# EasyEDA Pro project GD32F03C8T6最小系统板.eprj

# Schematic Schematic1
Create Date: 2024-03-12; Page Name: P1; Project Name: GD32F03C8T6最小系统板; Schematic Name: Schematic1; Update Date: 2024-07-16; Company: 嘉立创EDA; Page Size: A4; Version: V1.0
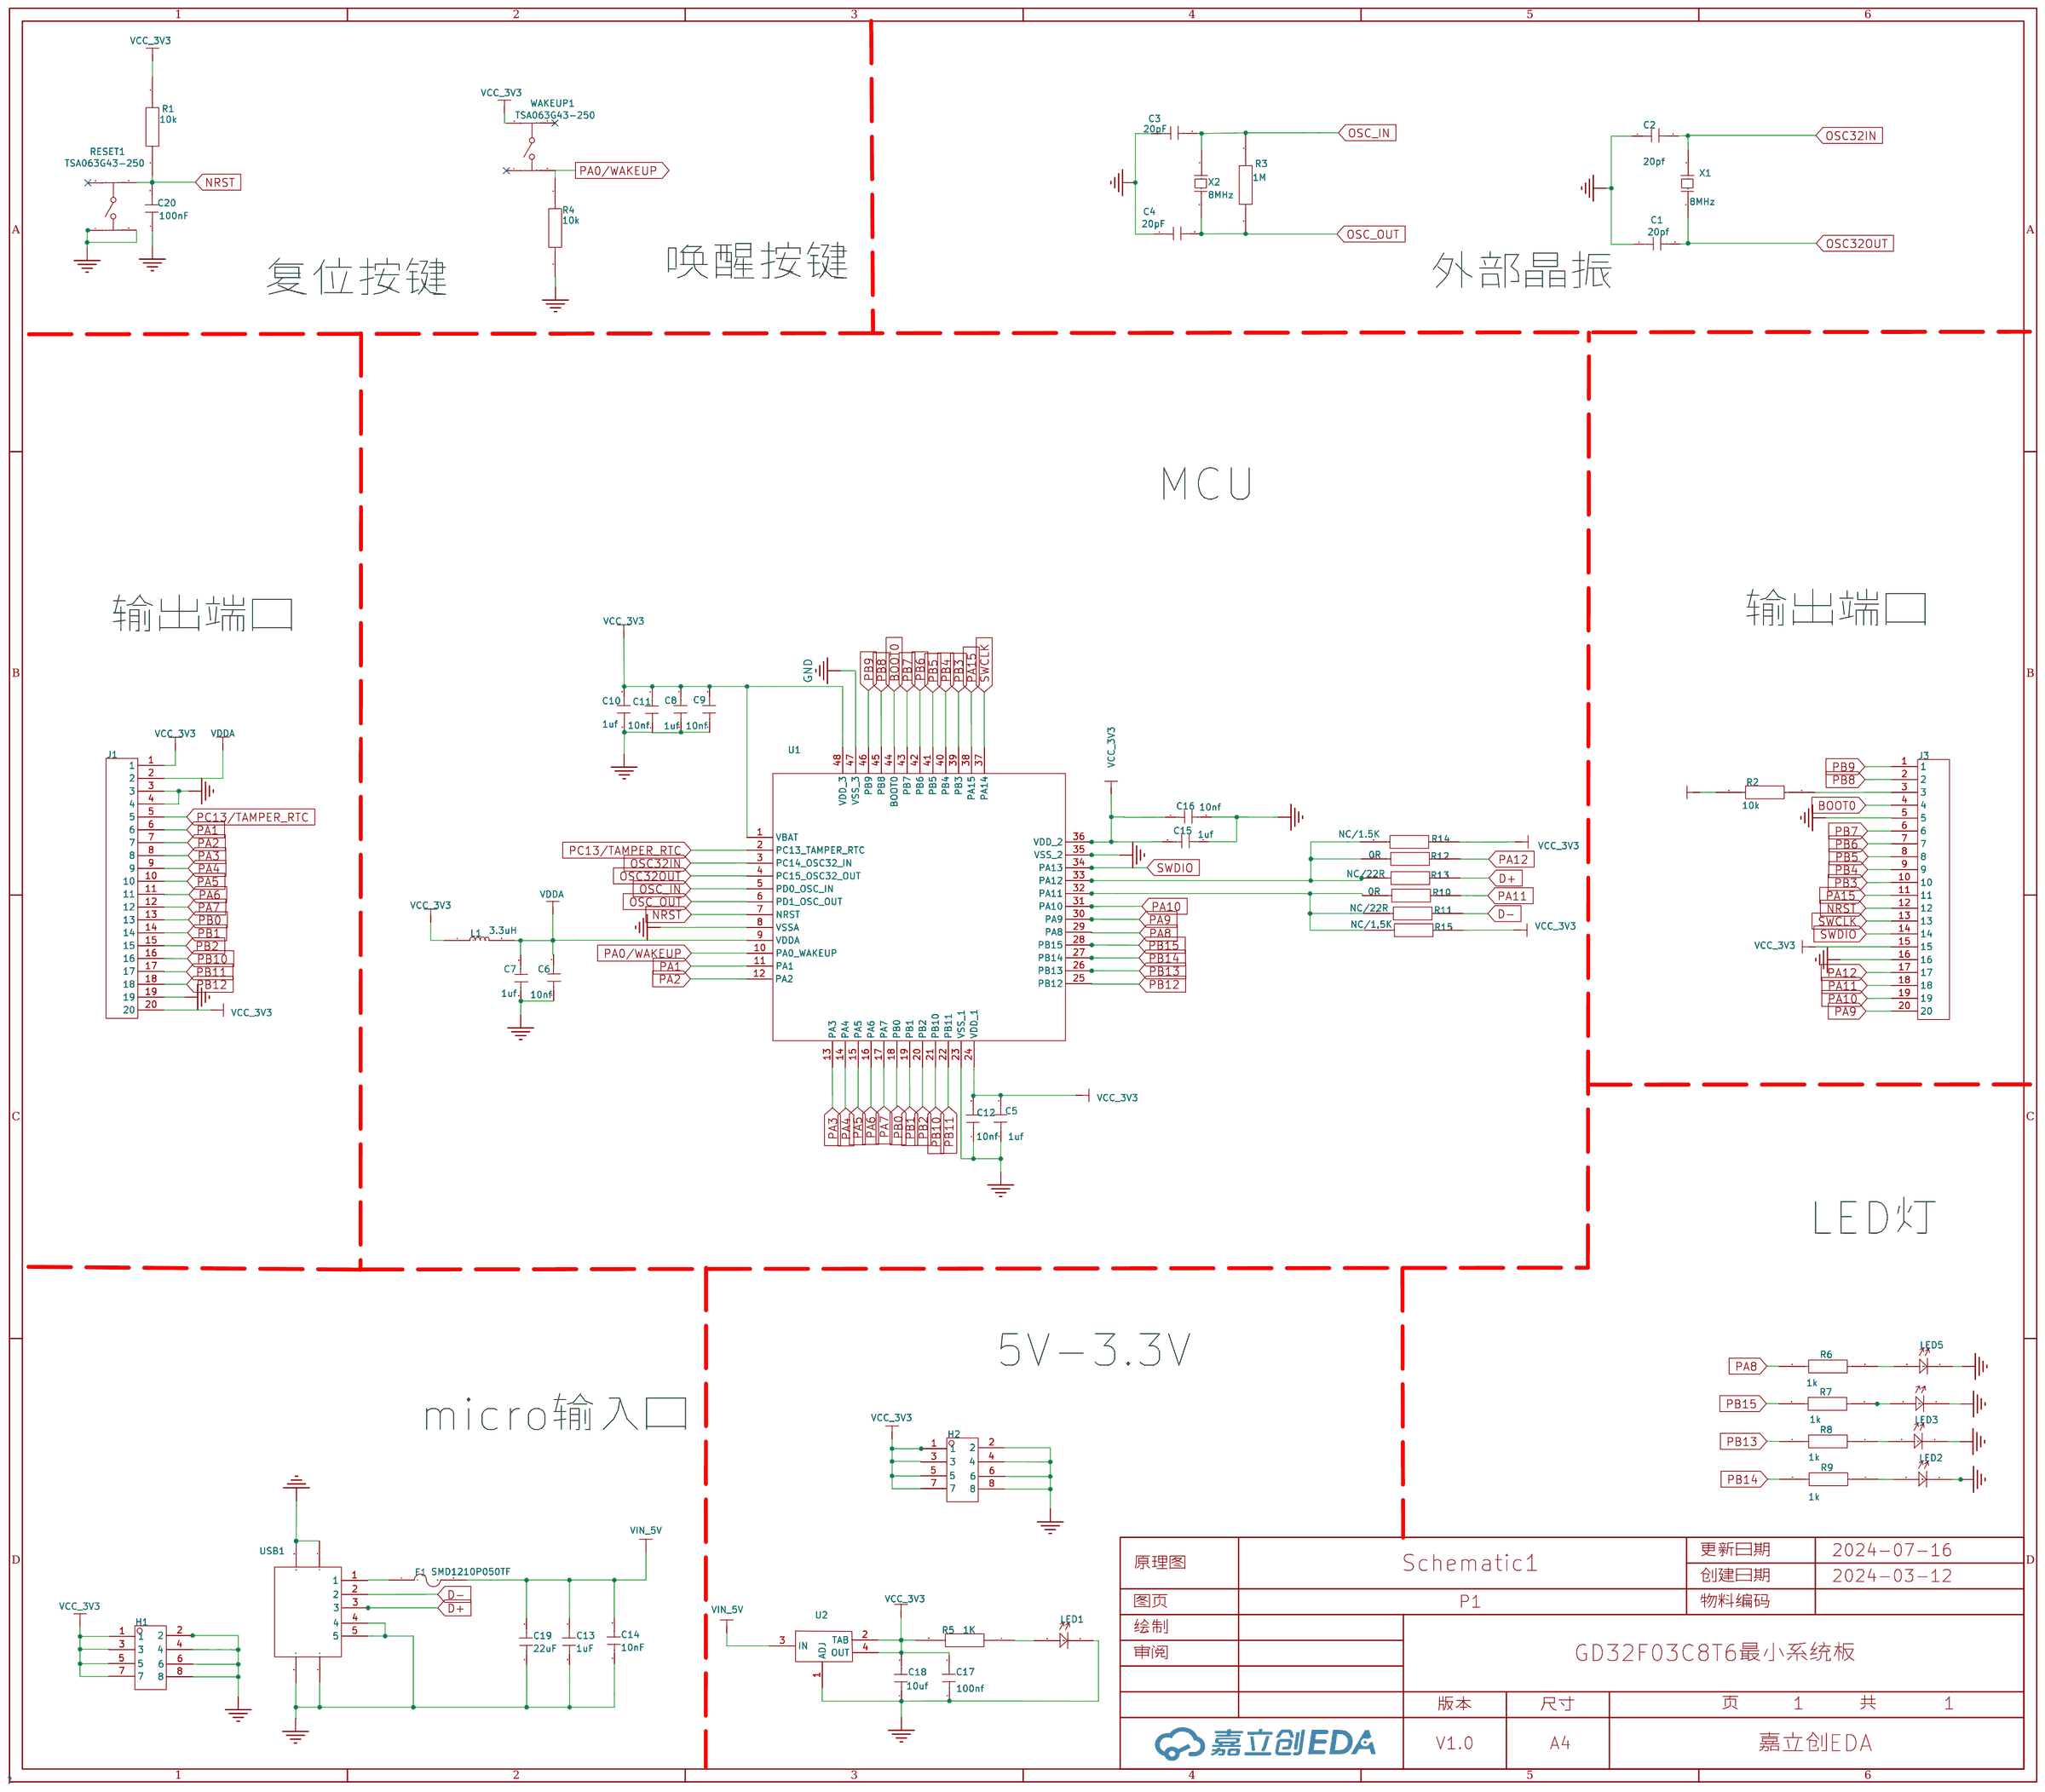
[diagram p0: schematic sheet]

## Parts
C1  20pf  [C0603]
C2  20pf  [C0603]
C3  20pF  [C0603]
C4  20pF  [C0603]
C5  1uf  [C0603]
C6  10nf  [C0603]
C7  1uf  [C0603]
C8  1uf  [C0603]
C9  10nf  [C0603]
C10  1uf  [C0603]
C11  10nf  [C0603]
C12  10nf  [C0603]
C13  1uF  [C0603]
C14  10nF  [C0603]
C15  1uf  [C0603]
C16  10nf  [C0603]
C17  100nf  [C0603]
C18  10uf  [C0805]
C19  22uF  [C0805]
C20  100nF  [C0603]
F1  SMD1210P050TF  [F1210]
H1  -  [HDR-TH_8P-P2.54-V-M-R2-C4-S2.54]
H2  -  [HDR-TH_8P-P2.54-V-M-R2-C4-S2.54]
J1  -  [HDR-TH_20PIN-V-MALE-PITCH2.54]
J3  -  [HDR-TH_20PIN-V-MALE-PITCH2.54]
L1  3.3uH  [L0603]
LED1  -  [LED0603]
LED2  -  [LED0603]
LED3  -  [LED0603]
LED4  -  [LED0603]
LED5  -  [LED0603]
R1  10k  [R0603]
R2  10k  [R0603]
R3  1M  [R0603]
R4  10k  [R0603]
R5  1K  [R0603]
R6  1k  [R0603]
R7  1k  [R0603]
R8  1k  [R0603]
R9  1k  [R0603]
R10  0R  [R0603]
R11  NC/22R  [R0603]
R12  0R  [R0603]
R13  NC/22R  [R0603]
R14  NC/1.5K  [R0603]
R15  NC/1.5K  [R0603]
RESET1  TSA063G43-250  [SW-SWD-T6X6-9.5X5.8]
U1  -  [TQFP-48_L7.0-W7.0-P0.50-LS9.0-BL]
U2  -  [SOT-223]
USB1  -  [MICRO-USB-SMD_U-F-M5DD-Y-1]
WAKEUP1  TSA063G43-250  [SW-SWD-T6X6-9.5X5.8]
X1  8MHz  [DT-38_BD3.1-P0.80]
X2  8MHz  [OSC-49S-1]

## Library data of the parts
C1-C20 = C
F1 = F
H1 H2 = PZ254V-12-8
J1 J3 = HDR-20P
L1 = 3.3uH
LED1-LED5 = LED
R1-R15 = 电阻
RESET1 WAKEUP1 = TSA063G43-205
U1 = GD32F103C8T6
U2 = AMS1117-3.3
USB1 = U-F-M5DD-Y-1
X1 X2 = 晶振

## Nets
GND: C3.1 C5.1 C7.2 C8.1 C9.1 C10.1 C14.1 C15.2 C17.1 C20.1 H1.4 H1.6 H1.8 H2.4 H2.6 H2.8 J3.16 LED1.1 LED2.1 LED3.1 LED4.1 LED5.1 R4.2 RESET1.3 U1.8(VSSA) U1.47(VSS_3) U2.1(ADJ) USB1.4 USB1.5 USB1.6 USB1.7 USB1.8 USB1.9
VCC_3V3: C8.2 C9.2 C10.2 C11.2 C12.2 C15.1 C17.2 C18.2 H1.3 H1.5 H1.7 H2.5 J3.15 R1.1 R2.2 R5.2 R14.1 R15.1 U1.1(VBAT) U1.36(VDD_2) U1.48(VDD_3) U2.2(TAB)
VDDA: C6.1 U1.9(VDDA)
VIN_5V: C13.2 C14.2 C19.2 F1.2 U2.3(IN)
BOOT0: J3.4 U1.44(BOOT0)
D+: R13.1 USB1.3
D-: R11.1 USB1.2
NRST: C20.2 J3.12 RESET1.1 U1.7(NRST)
OSC32IN: U1.3(PC14_OSC32_IN)
OSC32OUT: C1.2
OSC_IN: C3.2 U1.5(PD0_OSC_IN)
OSC_OUT: R3.2 U1.4(PC15_OSC32_OUT) U1.6(PD1_OSC_OUT) X2.1
PA0/WAKEUP: R4.1 U1.10(PA0_WAKEUP) WAKEUP1.3
PA1: U1.11(PA1)
PA2: U1.12(PA2)
PA6: J1.11
PA8: R6.2
PA9: J3.20
PA10: U1.31(PA10)
PA11: R10.1
PA12: R12.1
PA15: U1.38(PA15)
PB0: J1.13
PB3: U1.39(PB3)
PB4: U1.40(PB4)
PB5: J3.8 U1.41(PB5)
PB6: U1.42(PB6)
PB7: U1.43(PB7)
PB8: J3.2 U1.45(PB8)
PB9: J3.1 U1.46(PB9)
PB11: J1.17
PB13: R8.2
PB14: R9.2
PB15: R7.2
PC13/TAMPER_RTC: U1.2(PC13_TAMPER_RTC)
SWCLK: J3.13 U1.37(PA14)
SWDIO: U1.34(PA13)
$1N492: LED2.2 R9.1
$1N2898: LED1.2 R5.1
$1N9058: F1.1 USB1.1
$1N62745: LED3.2 R8.1
$1N62778: LED4.2 R7.1
$1N62791: LED5.2 R6.1
Net-(R12-2): R12.2 U1.33(PA12)
Net-(R15-2): R15.2 U1.32(PA11)

Not connected (* = marked no-connect by the designer): C1 1; C2 1 2; C4 1 2; C5 2; C6 2; C7 1; C11 1; C12 1; C13 1; C16 1 2; C18 1; C19 1; H1 1 2; H2 1 2 3 7; J1 1 2 3 4 5 6 7 8 9 10 12 14 15 16 18 19 20; J3 3 5 6 7 9 10 11 14 17 18 19; L1 1 2; R1 2; R2 1; R3 1; R10 2; R11 2; R13 2; R14 2; RESET1 2* 4; U1 13(PA3) 14(PA4) 15(PA5) 16(PA6) 17(PA7) 18(PB0) 19(PB1) 20(PB2) 21(PB10) 22(PB11) 23(VSS_1) 24(VDD_1) 25(PB12) 26(PB13) 27(PB14) 28(PB15) 29(PA8) 30(PA9) 35(VSS_2); U2 4(OUT); WAKEUP1 1* 2 4*; X1 1 2; X2 2

## Notes on the sheet
- 唤醒按键
- 复位按键
- 外部晶振
- MCU
- 输出端口
- 输出端口
- LED灯
- 5V-3.3V
- micro输入口

# Board PCB1
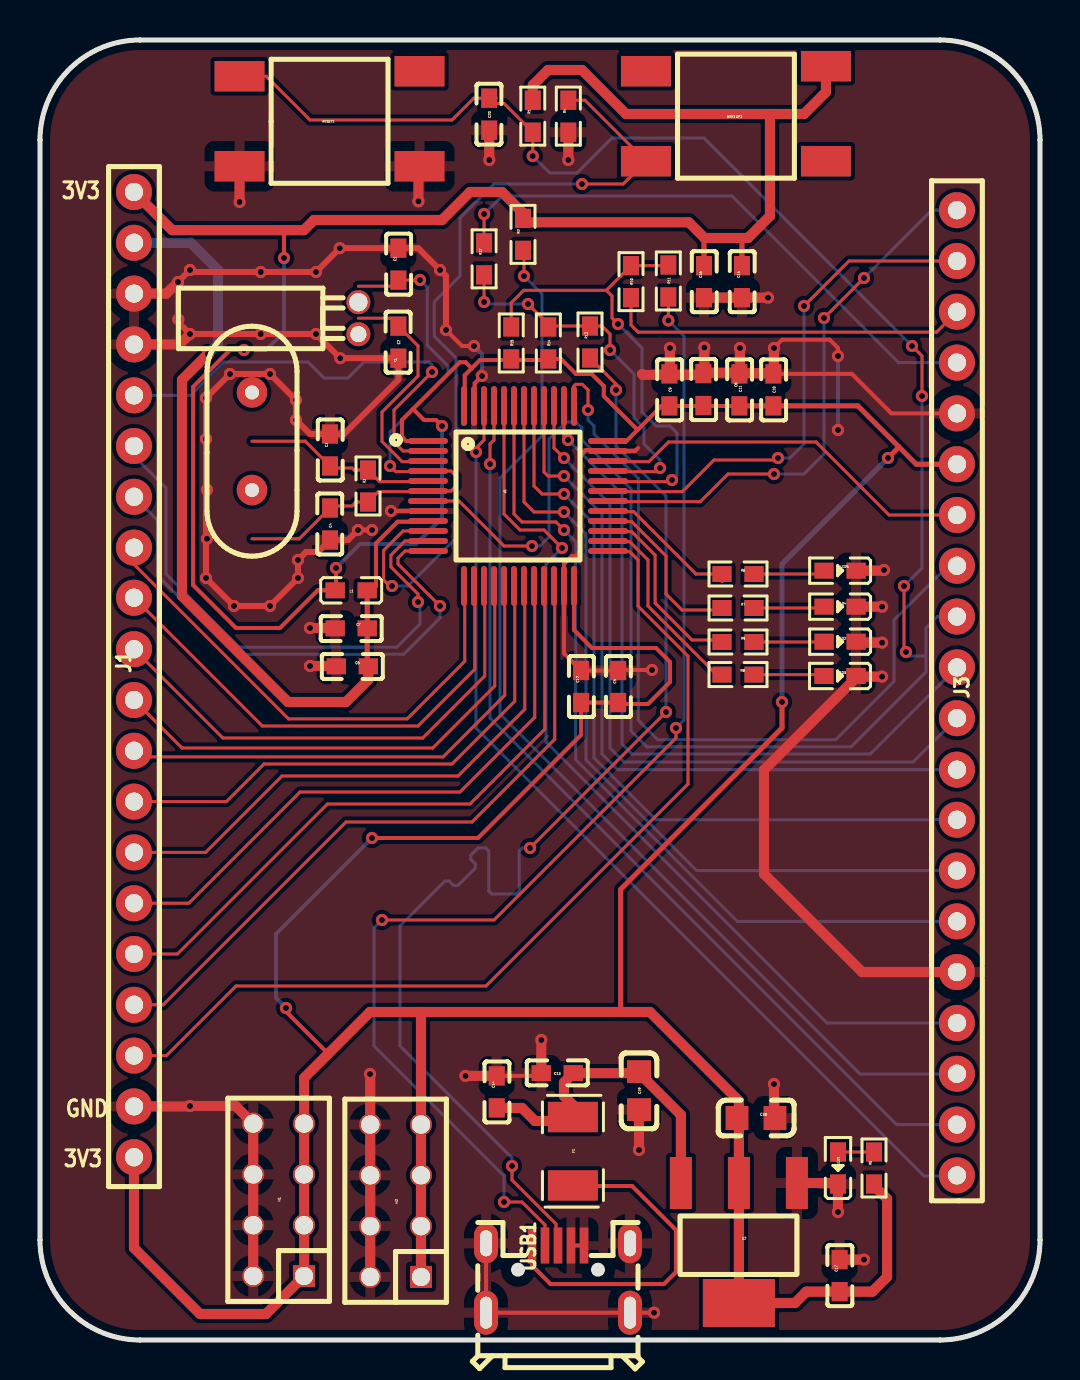
[diagram p1: board, top side]
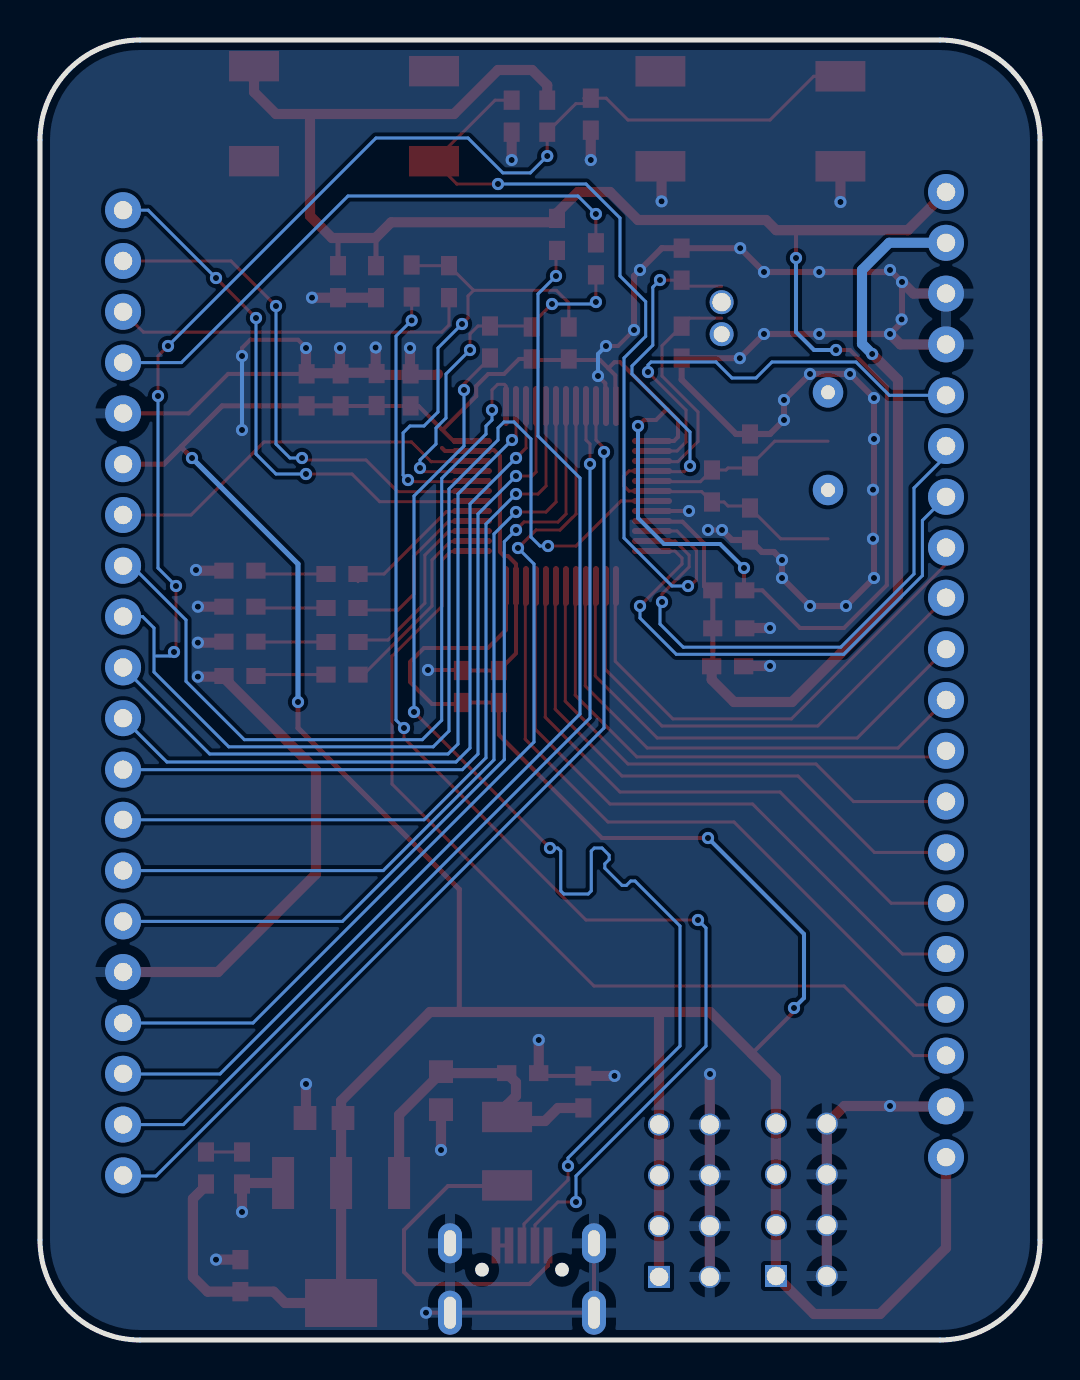
[diagram p2: board, bottom side, seen from below]

Outline 50 x 65 mm; copper layers: Top Layer, Bottom Layer. Coordinates in mm from the lower left corner of the outline.
Outline path: 0,60 0,5 arc(1.46,1.46) 5,0 45,0 arc(48.54,1.46) 50,5 50,60 arc(48.54,63.54) 45,65 5,65 arc(1.46,63.54) 0,60
Stack: Top Layer 0.035mm / Dielectric1 1.51mm FR4 er 4.5 / Bottom Layer 0.035mm

## Design rules (mm)
net GND: power
net VCC_3V3: power
net VIN_5V: power
net VDDA: power
net D+: DP1
net D-: DP1
net $1N9058: power
template: 自定义配置
spacing copperThickness1oz (default): track to track 0.203, other pairs 0.051 to 0.203
spacing copperThickness2oz: track to track 0.203, other pairs 0.152 to 0.3
track width copperThickness1oz (default): min 0.152, default 0.152, max 0.152
track width copperThickness2oz: min 0.152, default 0.152, max 0.152
track width power: min 0.203, default 0.508, max 2.54
differential pair differentialPair (default): width min 0.152, default 0.152, max 0.152; gap min 0.152, default 0.152
via viaSize (default): diameter min 0.5, default 0.61, max 10; hole min 0.3, default 0.305, max 6.299
net class power uses power
net GND uses power
net VCC_3V3 uses power
net VIN_5V uses power
net VDDA uses power
net $1N9058 uses power

## Placement (name value [footprint] x y rotation side)
C1  20pf  [C0603]  17.92 53.79 270 top
C2  20pf  [C0603]  17.92 49.89 90 top
C3  20pF  [C0603]  14.5 44.5 270 top
C4  20pF  [C0603]  14.5 40.8 90 top
C5  1uf  [C0603]  28.91 32.67 270 top
C6  10nf  [C0603]  15.62 33.69 180 top
C7  1uf  [C0603]  15.56 35.58 180 top
C8  1uf  [C0603]  34.97 47.51 270 top
C9  10nf  [C0603]  36.67 47.51 270 top
C10  1uf  [C0603]  31.47 47.51 270 top
C11  10nf  [C0603]  33.17 47.52 270 top
C12  10nf  [C0603]  27.06 32.67 270 top
C13  1uF  [C0603]  25.86 13.34 0 top
C14  10nF  [C0603]  22.84 12.4 270 top
C15  1uf  [C0603]  35.1 52.92 270 top
C16  10nf  [C0603]  33.2 52.92 270 top
C17  100nf  [C0603]  39.98 3.22 270 top
C18  10uf  [C0805]  35.8 11.1 180 top
C19  22uF  [C0805]  29.95 12.47 90 top
C20  100nF  [C0603]  22.46 61.29 90 top
F1  SMD1210P050TF  [F1210]  26.65 9.44 90 top
H1  -  [HDR-TH_8P-P2.54-V-M-R2-C4-S2.54]  13.2 3.2 90 top
H2  -  [HDR-TH_8P-P2.54-V-M-R2-C4-S2.54]  19.05 3.15 90 top
J1  -  [HDR-TH_20PIN-V-MALE-PITCH2.54]  4.7 57.4 270 top
J3  -  [HDR-TH_20PIN-V-MALE-PITCH2.54]  45.85 8.23 90 top
L1  3.3uH  [L0603]  15.56 37.48 0 top
LED1  -  [LED0603]  39.9 8.6 90 top
LED2  -  [LED0603]  40 34.92 180 top
LED3  -  [LED0603]  40 33.2 180 top
LED4  -  [LED0603]  40 36.67 180 top
LED5  -  [LED0603]  40 38.47 180 top
R1  10k  [R0603]  24.64 61.19 270 top
R2  10k  [R0603]  24.15 55.28 90 top
R3  1M  [R0603]  16.4 42.7 270 top
R4  10k  [R0603]  26.42 61.19 270 top
R5  1K  [R0603]  41.7 8.6 270 top
R6  1k  [R0603]  34.9 38.3 180 top
R7  1k  [R0603]  34.9 36.6 180 top
R8  1k  [R0603]  34.9 33.27 180 top
R9  1k  [R0603]  34.9 34.9 180 top
R10  0R  [R0603]  29.55 52.92 90 top
R11  NC/22R  [R0603]  31.42 52.95 90 top
R12  0R  [R0603]  22.2 54.06 270 top
R13  NC/22R  [R0603]  27.5 49.9 90 top
R14  NC/1.5K  [R0603]  25.42 49.85 90 top
R15  NC/1.5K  [R0603]  23.56 49.85 90 top
RESET1  TSA063G43-250  [SW-SWD-T6X6-9.5X5.8]  14.48 60.94 0 top
U1  -  [TQFP-48_L7.0-W7.0-P0.50-LS9.0-BL]  23.9 42.2 270 top
U2  -  [SOT-223]  37.85 7.85 180 top
USB1  -  [MICRO-USB-SMD_U-F-M5DD-Y-1]  25.9 3.1 270 top
WAKEUP1  TSA063G43-250  [SW-SWD-T6X6-9.5X5.8]  34.8 61.19 0 top
X1  8MHz  [DT-38_BD3.1-P0.80]  15.92 51.89 270 top
X2  8MHz  [OSC-49S-1]  10.6 42.5 90 top

## Footprints (pads in the part's own frame, mm; a bottom-side part is the same pattern mirrored in y, then rotated)
C0603
  rect 0.965x0.8 smd: 1(-0.8,0) 2(0.8,0)
C0805
  rect 1.14x1.2 smd: 1(-0.95,0) 2(0.95,0)
DT-38_BD3.1-P0.80
  round 1.2 hole 0.914x0.8: 1(0,0)
  round 1.2 hole 0.8: 2(1.6,0)
F1210
  rect 1.52x2.5 smd: 1(-1.71,0) 2(1.71,0)
HDR-TH_8P-P2.54-V-M-R2-C4-S2.54
  rect 1.1x1.1 hole 0.914: 1(0,0)
  round 1.1 hole 0.914: 2(0,2.54) 3(2.54,0) 4(2.54,2.54) 5(5.08,0) 6(5.08,2.54) 7(7.62,0) 8(7.62,2.54)
HDR-TH_20PIN-V-MALE-PITCH2.54
  round 1.8 hole 0.914: 1(0,0) 2(2.54,0) 3(5.08,0) 4(7.62,0) 5(10.168,0) 6(12.7,0) 7(15.24,0) 8(17.78,0) 9(20.285,0) 10(22.86,0) 11(25.4,0) 12(27.94,0) 13(30.48,0) 14(33.02,0) 15(35.56,0) 16(38.1,0) 17(40.64,0) 18(43.18,0) 19(45.72,0) 20(48.26,0)
L0603
  rect 0.965x0.8 smd: 1(-0.8,0) 2(0.8,0)
LED0603
  rect 0.965x0.8 smd: 1(-0.8,0) 2(0.8,0)
MICRO-USB-SMD_U-F-M5DD-Y-1
  rect 1.8x0.43 smd: 1(-1.626,-1.3) 2(-1.626,-0.65) 3(-1.626,0) 4(-1.626,0.65) 5(-1.626,1.3)
  oval 2x1.2 hole 1.3x0.6: 6(-1.735,3.599) 8(-1.735,-3.599)
  oval 2.2x1.2 hole 1.6x0.6: 7(1.735,3.599) 9(1.735,-3.599)
OSC-49S-1
  round 1.524 hole 0.7: 1(0,0) 2(4.88,0)
R0603
  rect 0.965x0.8 smd: 1(-0.8,0) 2(0.8,0)
SOT-223
  rect 1.1x2.6 smd: 1(0,0) 2(2.9,0) 3(5.8,0)
  rect 3.6x2.4 smd: 4(2.9,6)
SW-SWD-T6X6-9.5X5.8
  rect 2.5x1.524 smd: 1(-4.5,2.25) 2(4.5,2.5) 3(-4.5,-2.25) 4(4.5,-2.25)
TQFP-48_L7.0-W7.0-P0.50-LS9.0-BL
  oval 0.3x2 smd: 1(-2.75,-4.5) 2(-2.25,-4.5) 3(-1.75,-4.5) 4(-1.25,-4.5) 5(-0.75,-4.5) 6(-0.25,-4.5) 7(0.25,-4.5) 8(0.75,-4.5) 9(1.25,-4.5) 10(1.75,-4.5) 11(2.25,-4.5) 12(2.75,-4.5) 25(2.75,4.5) 26(2.25,4.5) 27(1.75,4.5) 28(1.25,4.5) 29(0.75,4.5) 30(0.25,4.5) 31(-0.25,4.5) 32(-0.75,4.5) 33(-1.25,4.5) 34(-1.75,4.5) 35(-2.25,4.5) 36(-2.75,4.5)
  oval 2x0.3 smd: 13(4.5,-2.7) 14(4.5,-2.2) 15(4.5,-1.7) 16(4.5,-1.2) 17(4.5,-0.7) 18(4.5,-0.2) 19(4.5,0.3) 20(4.5,0.8) 21(4.5,1.3) 22(4.5,1.8) 23(4.5,2.3) 24(4.5,2.8) 37(-4.5,2.8) 38(-4.5,2.3) 39(-4.5,1.8) 40(-4.5,1.3) 41(-4.5,0.8) 42(-4.5,0.3) 43(-4.5,-0.2) 44(-4.5,-0.7) 45(-4.5,-1.2) 46(-4.5,-1.7) 47(-4.5,-2.2) 48(-4.5,-2.7)

## Nets
GND: C1.1 C2.1 C3.1 C4.1 C5.1 C6.2 C7.2 C8.1 C9.1 C10.1 C11.1 C12.1 C13.1 C14.1 C15.2 C16.2 C17.1 C18.1 C19.1 C20.1 H1.2 H1.4 H1.6 H1.8 H2.2 H2.4 H2.6 H2.8 J1.3 J1.4 J1.19 J3.5 J3.16 LED1.1 LED2.1 LED3.1 LED4.1 LED5.1 R4.2 RESET1.3 RESET1.4 U1.8 U1.23 U1.35 U1.47 U2.1 USB1.4 USB1.5 USB1.6 USB1.7 USB1.8 USB1.9
VCC_3V3: C5.2 C8.2 C9.2 C10.2 C11.2 C12.2 C15.1 C16.1 C17.2 C18.2 H1.1 H1.3 H1.5 H1.7 H2.1 H2.3 H2.5 H2.7 J1.1 J1.20 J3.15 L1.1 R1.1 R2.2 R5.2 R14.1 R15.1 U1.1 U1.24 U1.36 U1.48 U2.2 U2.4 WAKEUP1.2
VDDA: C6.1 C7.1 J1.2 L1.2 U1.9
VIN_5V: C13.2 C14.2 C19.2 F1.2 U2.3
BOOT0: J3.4 U1.44
D+: R13.1 USB1.3
D-: R11.1 USB1.2
NRST: C20.2 J3.12 R1.2 RESET1.1 U1.7
OSC32IN: C2.2 U1.3 X1.2
OSC_IN: C3.2 R3.1 U1.5 X2.2
OSC_OUT: C1.2 C4.2 R3.2 U1.4 U1.6 X1.1 X2.1
PA0/WAKEUP: R4.1 U1.10 WAKEUP1.3
PA1: J1.6 U1.11
PA2: J1.7 U1.12
PA3: J1.8 U1.13
PA4: J1.9 U1.14
PA5: J1.10 U1.15
PA6: J1.11 U1.16
PA7: J1.12 U1.17
PA8: R6.2 U1.29
PA9: J3.20 U1.30
PA10: J3.19 U1.31
PA11: J3.18 R10.1
PA12: J3.17 R12.1
PA15: J3.11 U1.38
PB0: J1.13 U1.18
PB1: J1.14 U1.19
PB2: J1.15 U1.20
PB3: J3.10 U1.39
PB4: J3.9 U1.40
PB5: J3.8 U1.41
PB6: J3.7 U1.42
PB7: J3.6 U1.43
PB8: J3.2 U1.45
PB9: J3.1 U1.46
PB10: J1.16 U1.21
PB11: J1.17 U1.22
PB12: J1.18 U1.25
PB13: R8.2 U1.26
PB14: R9.2 U1.27
PB15: R7.2 U1.28
PC13/TAMPER_RTC: J1.5 U1.2
SWCLK: J3.13 U1.37
SWDIO: J3.14 U1.34
$1N492: LED2.2 R9.1
$1N2898: LED1.2 R5.1
$1N8436: R10.2 R11.2 R15.2 U1.32
$1N9058: F1.1 USB1.1
$1N15482: J3.3 R2.1
$1N56581: R12.2 R13.2 R14.2 U1.33
$1N62745: LED3.2 R8.1
$1N62778: LED4.2 R7.1
$1N62791: LED5.2 R6.1

Pads without a net: RESET1 2; WAKEUP1 1 4

## Via types
v1: diameter 0.61, hole 0.305, Top Layer to Bottom Layer, 110 vias

## Routing (per net, layer and track width the routed paths; a pad name or vN(x,y) marks a point on that pad's centre or on a via; arc(x,y) is an arc through that point)
GND: length 216.3
  Top Layer w0.203: U1.8 v1(17.55,41.45) ; v1(30.6,33.5) 28.94,33.5 C5.1 C12.1 26.2,34.33 U1.23 26.2,38.8 26.6,39.2 26.8,39.2 27,39.4 27,44.2 27.3,44.5 27.48,44.5 ; U1.35 29.75,44.45 29.9,44.6 ; v1(20.3,50.5) 21.1,49.7 v1(21.7,49.7) ; 22.3,4.84 22.3,1.37 USB1.7 v1(30.7,1.37) ; 29.53,4.8 USB1.6 ; C14.1 24.92,13.2 C13.1 ; v1(36.7,49.6) 36.7,49.61 37.1,50.01 39.49,50.01 39.9,49.6 v1(39.9,49.2) ; 40.53,38.47 LED5.1 ; C9.1 40.59,48.31 42.57,46.33 45.85,46.33 ; 21.74,46.67 21.74,47.84 v1(22.1,48.2) ; USB1.4 USB1.5
  Top Layer w0.254: v1(15.9,40.5) v1(16.6,40.5)
  Top Layer w0.305: v1(15.9,40.5) 15.4,40 C4.1 13.9,39.4 13.3,39.4 v1(12.9,39) v1(12.9,38.1) v1(11.5,36.7) v1(9.7,36.7) v1(8.3,38.1) v1(8.3,45.05) v1(8.3,47.1) v1(9.5,48.3) v1(11.5,48.3) v1(12.8,47) v1(12.8,46) 13.5,45.3 C3.1 15.2,45.3 17.92,48.02 C2.1 v1(15.01,49.09) v1(13.8,50.3) v1(11.04,50.3) v1(7.5,50.3) 6.9,50.9 v1(6.9,52.9) 7.4,53.4 v1(11.04,53.4) v1(13.8,53.4) v1(14.99,54.59) C1.1 18.91,54.59 v1(20,53.5) 20.3,53.2 v1(20.3,50.5)
  Top Layer w0.508: J1.19 7.48,11.68 v1(7.5,11.7) 9.78,11.7 H1.8 H1.6 H1.4 H1.2 ; C16.2 C15.2 v1(36.4,52.12) ; 40.76,36.67 40.74,36.68 ; 40.76,36.67 40.66,36.67 ; 40.76,36.67 v1(42.1,36.67) ; v1(13.5,35.6) 14.74,35.6 C7.2 ; J1.4 6.98,49.78 v1(7.5,50.3) ; C17.1 v1(41.2,4.02) ; 31.5,48.26 33.1,48.26 C11.1 ; 31.5,48.26 31.48,48.24 ; 31.5,48.26 v1(31.5,49.6) ; 31.5,48.26 30.14,48.26 30.1,48.3 ; v1(35,49.6) 35,48.36 34.98,48.34 36.63,48.34 C9.1 ; 29.95,11.32 v1(29.95,9.5) ; C20.1 v1(22.46,59) ; v1(13.5,33.7) 14.74,33.7 14.76,33.68 ; H2.2 H2.4 H2.6 H2.8 16.51,13.29 v1(16.5,13.3) ; C8.1 34.91,48.36 33.2,48.36 33.22,48.38 v1(33.22,49.62) ; C14.1 v1(21.27,13.2) ; J1.3 6.32,52.32 v1(6.9,52.9) ; v1(42.2,38.5) 42.17,38.47 LED5.1 ; 18.92,58.72 v1(18.92,56.93) ; RESET1.3 v1(9.98,56.9) ; v1(36.7,49.6) 36.7,48.36 36.68,48.34 ; v1(42.1,33.17) 40.86,33.17 ; 40.86,33.17 36.2,28.5 36.2,23.3 41.1,18.4 J3.5 ; 40.86,33.17 40.84,33.18 ; C13.1 v1(25.06,15) ; v1(36.7,12.8) 36.7,10.98 ; v1(42.1,34.87) 40.76,34.87 40.74,34.88 ; U2.1 39.85,7.85 LED1.1 v1(39.9,6.4) ; R4.2 v1(26.42,59)
  Bottom Layer w0.203: v1(22.1,48.2) 22.1,49.3 v1(21.7,49.7) ; v1(39.9,45.5) v1(39.9,49.2)
  vias: v1(6.92,51.03) v1(7.5,53.5) v1(8.35,42.51) v1(8.35,40.06)
VCC_3V3: length 305.5
  Top Layer w0.203: 21.58,48.58 22,49 25.37,49 ; 21.58,48.58 21.28,48.89 20.99,48.89 18.63,46.53 ; 21.58,48.58 21.24,48.24 21.24,46.67 ; v1(14.8,38.6) 14.8,37.52 L1.1 13.88,37.48 12,35.6 9.8,35.6 7.66,37.74 7.66,47.66 9.5,49.5 v1(10.2,49.5) ; 29.92,45.54 29.84,45.54 28.19,47.19 28.19,47.7 27.59,48.3 26.8,48.3 26.05,49.05 R14.1 ; 29.92,45.54 29.29,44.92 28.44,44.92 ; 29.92,45.54 31.07,46.7 34.76,46.7 ; 18.63,46.53 18.67,46.53 19.2,46 19.8,46 v1(20.1,45.7) ; 18.63,46.53 18.1,46 18.1,45.15 18.3,44.95 U1.1 ; v1(16.6,25.1) 21.9,25.1 27.06,30.26 C12.2 C5.2 28.98,31.8 30.4,31.8 31.5,32.9 31.5,33.9 30.8,34.6 27.6,34.6 26.7,35.5 U1.24 ; v1(12.3,16.6) 12.3,16.42 14.41,14.31 ; v1(12.2,54.1) 12.2,55.44 12.15,55.49 ; J1.1 5.1,57.4
  Top Layer w0.254: J3.15 43.81,43.79 42.93,44.67 ; v1(37.1,31.9) 37.1,30.6 29.03,22.53 29.03,16.4 ; 42.93,44.67 42.93,44.63 v1(42.4,44.1) ; 42.93,44.67 40.89,46.71 C9.2 C8.2 ; C16.1 33.2,55.07 33.23,55.1 ; C15.1 35.1,55.09 35.11,55.1
  Top Layer w0.508: 24.15,55.88 24.16,55.89 32.44,55.89 33.23,55.1 35.4,55.1 36.5,56.2 36.5,61.3 ; J1.1 6.61,55.49 13.19,55.49 13.7,56 20.1,56 21.5,57.4 23.1,57.4 24.15,56.35 R2.2 ; 19.05,16.4 16.5,16.4 14.41,14.31 13.21,13.11 13.21,3.41 13,3.2 ; 19.05,16.4 30.5,16.4 34.95,11.95 U2.2 34.95,2.95 35.8,2.1 ; 19.05,16.4 H2.7 H2.5 H2.3 H2.1 ; WAKEUP1.2 39.3,62.4 38.2,61.3 36.5,61.3 ; 36.5,61.3 29.3,61.3 27.1,63.5 25.4,63.5 24.64,62.74 R1.1 ; H1.1 11.3,1.3 8,1.3 4.7,4.6 J1.20 ; U2.4 37.75,1.85 38.32,2.42 C17.2 41.62,2.42 42.35,3.15 42.35,7.06 41.7,7.72 R5.2
  Bottom Layer w0.203: v1(14.8,38.6) 16,39.8 18.8,39.8 20.1,41.1 v1(20.1,45.7) ; v1(10.2,49.5) 11.3,49.5 12.2,50.4 v1(12.2,54.1) ; v1(12.3,16.6) 11.8,17.1 11.8,20.3 v1(16.6,25.1)
  Bottom Layer w0.254: v1(37.1,31.9) 37.1,38.8 v1(42.4,44.1)
VDDA: length 44
  Top Layer w0.203: 19.44,40.92 17.88,40.92 16.8,39.84 16.8,37.69 16.6,37.48 L1.2
  Top Layer w0.254: C6.1 16.36,33.74 C7.1 L1.2
  Top Layer w0.508: C6.1 16.42,33.02 15.3,31.9 12.4,31.9 7.1,37.2 7.1,48.01 v1(8.39,49.3)
  Bottom Layer w0.508: v1(8.39,49.3) 8.9,49.81 8.9,53.5 7.54,54.86 J1.2
VIN_5V: length 16.4
  Top Layer w0.508: U2.3 32.05,11.25 29.96,13.34 C13.2 26.2,12.88 26.2,12.2 26.65,11.75 F1.2 26.45,10.95 24.75,10.95 24.1,11.6 22.84,11.6 C14.2
BOOT0: length 45.4
  Top Layer w0.152: v1(26.1,39.6) 25.2,40.5 24,40.5 23.2,41.3 U1.44
  Bottom Layer w0.152: v1(26.1,39.6) 25.3,38.8 25.3,29.9 39.35,15.85 J3.4
D+: length 61.4
  Top Layer w0.152: v1(28.8,47.5) 28.8,47.8 R13.1 ; v1(23.6,8.7) 23.6,8 25.8,5.8 25.8,4.83 USB1.3 ; v1(24.5,24.6) v1(31.3,31.4)
  Bottom Layer w0.152: v1(28.8,47.5) 28.8,44.7 31.3,42.2 v1(31.3,31.4) ; v1(24.5,24.6) 24.11,24.6 23.96,24.45 23.96,22.45 23.81,22.3 22.59,22.3 22.44,22.45 22.44,24.45 22.28,24.6 21.9,24.6 21.54,24.24 21.54,24.03 21.76,23.81 21.76,23.59 20.9,22.73 20.68,22.73 20.46,22.95 20.25,22.95 18,20.7 18,14.7 23.6,9.1 v1(23.6,8.7)
D-: length 61.5
  Top Layer w0.152: v1(17.1,21) 22.7,21 31.8,30.1 v1(31.8,30.6) ; v1(23.2,6.9) 24.1,6.9 25.25,5.75 USB1.2 ; R11.1 v1(31.42,50.98)
  Bottom Layer w0.152: v1(31.8,30.6) 32.2,31 32.2,50.19 v1(31.42,50.98) ; v1(17.1,21) 16.7,20.6 16.7,14.7 23.2,8.2 v1(23.2,6.9)
NRST: length 110.1
  Top Layer w0.152: v1(43.6,49.7) 44.1,49.2 v1(44.1,47.2) ; v1(43.2,37.7) 43.2,34.5 v1(43.3,34.4) ; 22.68,61.82 23.21,61.82 R1.2 v1(24.64,59.2) ; RESET1.1 11.31,63.19 13.5,61 20.6,61 21.69,62.09 C20.2 22.81,62.09 ; U1.7 20.95,41.95 23.2,39.7 v1(24.6,39.7)
  Bottom Layer w0.152: 44.2,34.2 43.5,34.2 v1(43.3,34.4) ; v1(24.64,59.2) 25.48,58.36 26.86,58.36 28.6,60.1 33.2,60.1 v1(43.6,49.7) ; v1(43.2,37.7) 44.1,38.6 v1(44.1,47.2) ; 45.85,36.17 44.87,36.17 44.3,35.6 44.3,33.4 40.56,29.66 30.34,29.66 29.55,30.45 29.55,42.55 27.1,45 27.1,45.6 26.8,45.9 26.3,45.9 25.45,45.05 25.45,40.15 25,39.7 v1(24.6,39.7)
OSC32IN: length 11.8
  Top Layer w0.152: 15.92,51.09 17.52,51.09 C2.2 18.9,49.71 18.9,48.2 17.1,46.4 17.1,44.93 18.11,43.92 19.44,43.92
OSC_IN: length 9.7
  Top Layer w0.152: 19.44,42.92 16.98,42.92 R3.1 15.7,43.5 15.6,43.6 14.6,43.6 C3.2 13.26,44.94 10.6,44.94
OSC_OUT: length 29.6
  Top Layer w0.152: v1(19,53) 18.99,52.99 C1.2 17.62,52.69 15.92,52.69 ; U1.4 20.55,43.45 20.8,43.2 20.8,42.7 20.55,42.45 U1.6 ; C4.2 12.96,40.06 10.6,40.06 ; v1(17.5,43.7) 17.78,43.42 19.44,43.42 ; 14.6,41.6 14.7,41.7 15.6,41.7 15.8,41.9 R3.2 16.92,42.42 19.44,42.42
  Bottom Layer w0.152: v1(19,53) 19.36,52.64 19.36,49.74 20.4,48.7 20.4,48.3 17.5,45.4 v1(17.5,43.7)
PA0/WAKEUP: length 41.4
  Top Layer w0.152: v1(27.1,57.8) 29.16,57.8 WAKEUP1.3 27.25,61.99 R4.1 ; U1.10 18.15,40.45 17.18,39.48 17.18,38 17.48,37.7 v1(17.6,37.7)
  Bottom Layer w0.152: v1(27.1,57.8) 22.7,57.8 21,56.1 21,53.2 19.72,51.92 19.72,50.18 20.8,49.1 20.8,40.1 18.4,37.7 v1(17.6,37.7)
PA1: length 28
  Top Layer w0.152: v1(18.9,36.9) 18.9,37.3 17.54,38.65 17.54,39.24 18.25,39.95 U1.11
  Bottom Layer w0.152: v1(18.9,36.9) 19,36.8 19,35.8 17.84,34.64 9.96,34.64 6.3,38.3 6.3,42.6 4.7,44.2 J1.6
PA2: length 26.4
  Top Layer w0.152: U1.12 18.25,39.45 17.9,39.1 17.9,38.8 v1(20,36.7)
  Bottom Layer w0.152: J1.7 5.88,40.98 5.88,38.22 9.82,34.28 18.18,34.28 20,36.1 v1(20,36.7)
PA3: length 25.5
  Top Layer w0.152: J1.8 4.7,38.78 12.43,31.06 18.36,31.06 21.24,33.94 21.24,37.67
PA4: length 25
  Top Layer w0.152: 21.74,37.67 21.74,33.54 18.9,30.7 11.11,30.7 J1.9
PA5: length 25.1
  Top Layer w0.152: 22.24,37.67 22.24,33.2 19.14,30.1 9.14,30.1 J1.10
PA6: length 25.3
  Top Layer w0.152: 22.74,37.67 22.74,32.7 19.64,29.6 7.1,29.6 J1.11
PA7: length 25.4
  Top Layer w0.152: 23.24,37.67 23.24,32.24 20.16,29.16 5,29.16 J1.12
PA8: length 7.3
  Top Layer w0.152: 34.1,37.92 R6.2 32.8,38.3 29.68,41.42 28.44,41.42
PA9: length 27.4
  Top Layer w0.152: v1(39.2,51.1) v1(41.2,53.1) ; 28.44,41.92 33.02,41.92 34.4,43.3 v1(36.7,43.3)
  Bottom Layer w0.152: v1(36.7,43.3) 38.2,43.3 39.2,44.3 v1(39.2,51.1) ; v1(41.2,53.1) 44.59,56.49 45.85,56.49
PA10: length 26.2
  Top Layer w0.152: v1(36.9,44.1) 36.8,44 33.7,44 32.12,42.42 28.44,42.42 ; J3.19 40.45,53.95 v1(38.2,51.7)
  Bottom Layer w0.152: v1(38.2,51.7) 38.2,44.8 37.5,44.1 v1(36.9,44.1)
PA11: length 18.2
  Top Layer w0.152: R10.1 29.55,50.75 29.91,50.39 44.83,50.39 J3.18
PA12: length 28.9
  Top Layer w0.152: R12.1 v1(22.2,56.3)
  Bottom Layer w0.152: v1(22.2,56.3) 23.1,57.2 34.6,57.2 42.93,48.87 J3.17
PA15: length 36.8
  Top Layer w0.152: v1(26.4,45) 26.2,45.2 U1.38
  Bottom Layer w0.152: J3.11 41.52,29.3 29.6,29.3 29.1,29.8 29.1,42.3 v1(26.4,45)
PB0: length 26.8
  Top Layer w0.152: 23.74,37.67 23.74,31.94 20.6,28.8 11.2,28.8 9.32,26.92 J1.13
PB1: length 28.6
  Top Layer w0.152: J1.14 8.28,24.38 12.1,28.2 20.9,28.2 24.24,31.54 24.24,37.67
PB2: length 30.4
  Top Layer w0.152: J1.15 7.44,21.84 13,27.4 21,27.4 24.74,31.14 24.74,37.67
PB3: length 36.8
  Top Layer w0.152: v1(26.2,44.1) 25.7,44.6 U1.39
  Bottom Layer w0.152: J3.10 43.66,28.9 29.2,28.9 28.5,29.6 28.5,41.8 v1(26.2,44.1)
PB4: length 37.1
  Top Layer w0.152: v1(26.2,43.2) 25.4,43.2 25.2,43.4 U1.40
  Bottom Layer w0.152: v1(26.2,43.2) 28.1,41.3 28.1,29.3 28.88,28.52 J3.9
PB5: length 38.9
  Top Layer w0.152: U1.41 24.7,42.7 25.1,42.3 v1(26.2,42.3)
  Bottom Layer w0.152: v1(26.2,42.3) 27.7,40.8 27.7,29.11 30.8,26.01 J3.8
PB6: length 40.7
  Top Layer w0.152: U1.42 24.2,41.9 24.7,41.4 v1(26.2,41.4)
  Bottom Layer w0.152: v1(26.2,41.4) 27.3,40.3 27.3,29.01 32.84,23.47 45.85,23.47
PB7: length 42.4
  Top Layer w0.152: U1.43 23.7,41.3 24.1,40.9 25.8,40.9 v1(26.2,40.5)
  Bottom Layer w0.152: v1(26.2,40.5) 26.78,39.92 26.78,29.02 34.88,20.93 J3.6
PB8: length 47.6
  Top Layer w0.152: v1(22.5,43.8) 22.5,44.8 22.7,45 U1.45 22.77,46.63
  Bottom Layer w0.152: J3.2 42.83,10.77 22.5,31.1 v1(22.5,43.8)
PB9: length 49.6
  Top Layer w0.152: v1(21.8,44.4) 21.8,44.6 22.2,45 U1.46
  Bottom Layer w0.152: v1(21.8,44.4) 21.8,30.6 44.2,8.2 45.82,8.2 J3.1
PB10: length 32.3
  Top Layer w0.152: 25.24,37.67 25.24,30.54 21.5,26.8 14.37,26.8 6.87,19.3 J1.16
PB11: length 34.2
  Top Layer w0.152: J1.17 6.16,16.76 15.3,25.9 21.6,25.9 25.74,30.04 25.74,37.67
PB12: length 47.2
  Top Layer w0.152: J1.18 6.32,14.22 9.8,17.7 22.3,17.7 32.4,27.8 32.4,34.19 29.9,36.69 29.9,39 29.48,39.42 28.44,39.42
PB13: length 9.8
  Top Layer w0.152: 28.44,39.92 29.49,39.92 30.4,39 30.4,36.7 33.83,33.27 R8.2
PB14: length 9.8
  Top Layer w0.152: 28.44,40.42 29.58,40.42 30.76,39.24 30.76,36.84 32.6,35 34,35 R9.2 33.8,34.6
PB15: length 8.6
  Top Layer w0.152: R7.2 34,36.5 32.1,36.5 31.3,37.3 31.3,39.2 29.59,40.92 28.44,40.92
PC13/TAMPER_RTC: length 22.8
  Top Layer w0.152: v1(19.6,48.4) 19.6,48.4 17.7,46.5 17.7,44.9 18.15,44.45 U1.2
  Bottom Layer w0.152: J1.5 7.53,47.23 9.2,48.9 13.4,48.9 14.2,48.1 15.4,48.1 16.2,48.9 19.45,48.9 19.6,48.75 v1(19.6,48.4)
SWCLK: length 41.1
  Top Layer w0.152: v1(27.4,46.5) 27.4,47.5 27.12,47.78 26.78,47.78 26.7,47.7 U1.37
  Bottom Layer w0.152: v1(27.4,46.5) 27.4,46 27.7,45.7 27.7,45.3 29.92,43.08 29.92,30.98 30.88,30.02 39.78,30.02 42.7,32.93 42.7,36 45.41,38.71 J3.13
SWDIO: length 19.3
  Top Layer w0.152: 28.44,43.92 30.44,43.92 31.43,44.9 38.8,44.9 42.45,41.25 J3.14
$1N492: length 3.5
  Top Layer w0.152: 39.12,35 LED2.2 ; R9.1 39.12,34.9
$1N2898: length 1.8
  Top Layer w0.152: LED1.2 R5.1
$1N8436: length 24.5
  Top Layer w0.152: 28.32,52.48 R10.2 31.38,53.72 R11.2 ; 28.32,52.48 24.18,52.48 23.56,51.86 R15.2 ; 28.32,52.48 28.6,52.2 28.6,51.1 v1(28.9,50.8) ; v1(31.6,43) 31.52,42.92 28.44,42.92
  Bottom Layer w0.152: v1(28.9,50.8) 30.1,49.6 30.1,46.4 30.8,45.7 31.5,45.7 31.84,45.36 31.84,43.24 v1(31.6,43)
$1N9058: length 17.1
  Top Layer w0.203: USB1.1 24.6,3.72 25.53,2.8 31.2,2.8 31.8,3.4 31.8,5.5 29.6,7.7 26.82,7.7 26.65,7.53
$1N15482: length 54.8
  Top Layer w0.152: R2.1 24.2,54.43 v1(24.2,53.2)
  Bottom Layer w0.152: v1(24.2,53.2) 25.1,52.3 25.1,45.2 23,43.1 23,31.3 41,13.3 45.84,13.3 J3.3
$1N56581: length 18.8
  Top Layer w0.152: v1(28.5,49.5) 28.5,50.3 28.1,50.7 R13.2 25.47,50.7 R14.2 25.42,50.78 v1(24.4,51.8) ; R12.2 v1(22.2,51.9) ; 28.44,43.42 30.82,43.42 v1(31,43.6)
  Bottom Layer w0.152: v1(28.5,49.5) 29.7,48.3 29.7,46.1 30.2,45.6 30.2,44.8 31,44 v1(31,43.6) ; v1(24.4,51.8) 22.3,51.8 v1(22.2,51.9)
$1N62745: length 3.6
  Top Layer w0.152: 39.03,33.37 LED3.2 ; R8.1 39.03,33.27
$1N62778: length 3.8
  Top Layer w0.152: 39.17,36.7 39.27,36.7 ; 39.17,36.7 39.07,36.8 ; 39.17,36.7 LED4.2 ; R7.1 39.17,36.6
$1N62791: length 3.6
  Top Layer w0.152: 39.17,38.5 LED5.2 ; R6.1 39.27,38.3

## Copper pours and planes (outline as drawn; the poured copper is in the pictures)
GND on Top Layer: -26.4,85.7 77.1,85.7 77.1,-34.8 -26.4,-34.8
GND on Bottom Layer: -12.8,86.8 59.8,86.8 59.8,-20.1 -12.8,-20.1

## Text on the board
Top Silkscreen Layer: GND | 3V3
